# Altium schematic sheet Audio-Interface.SchDoc
size 420 x 297 mm; SheetNumber: 4; SheetTotal: 4
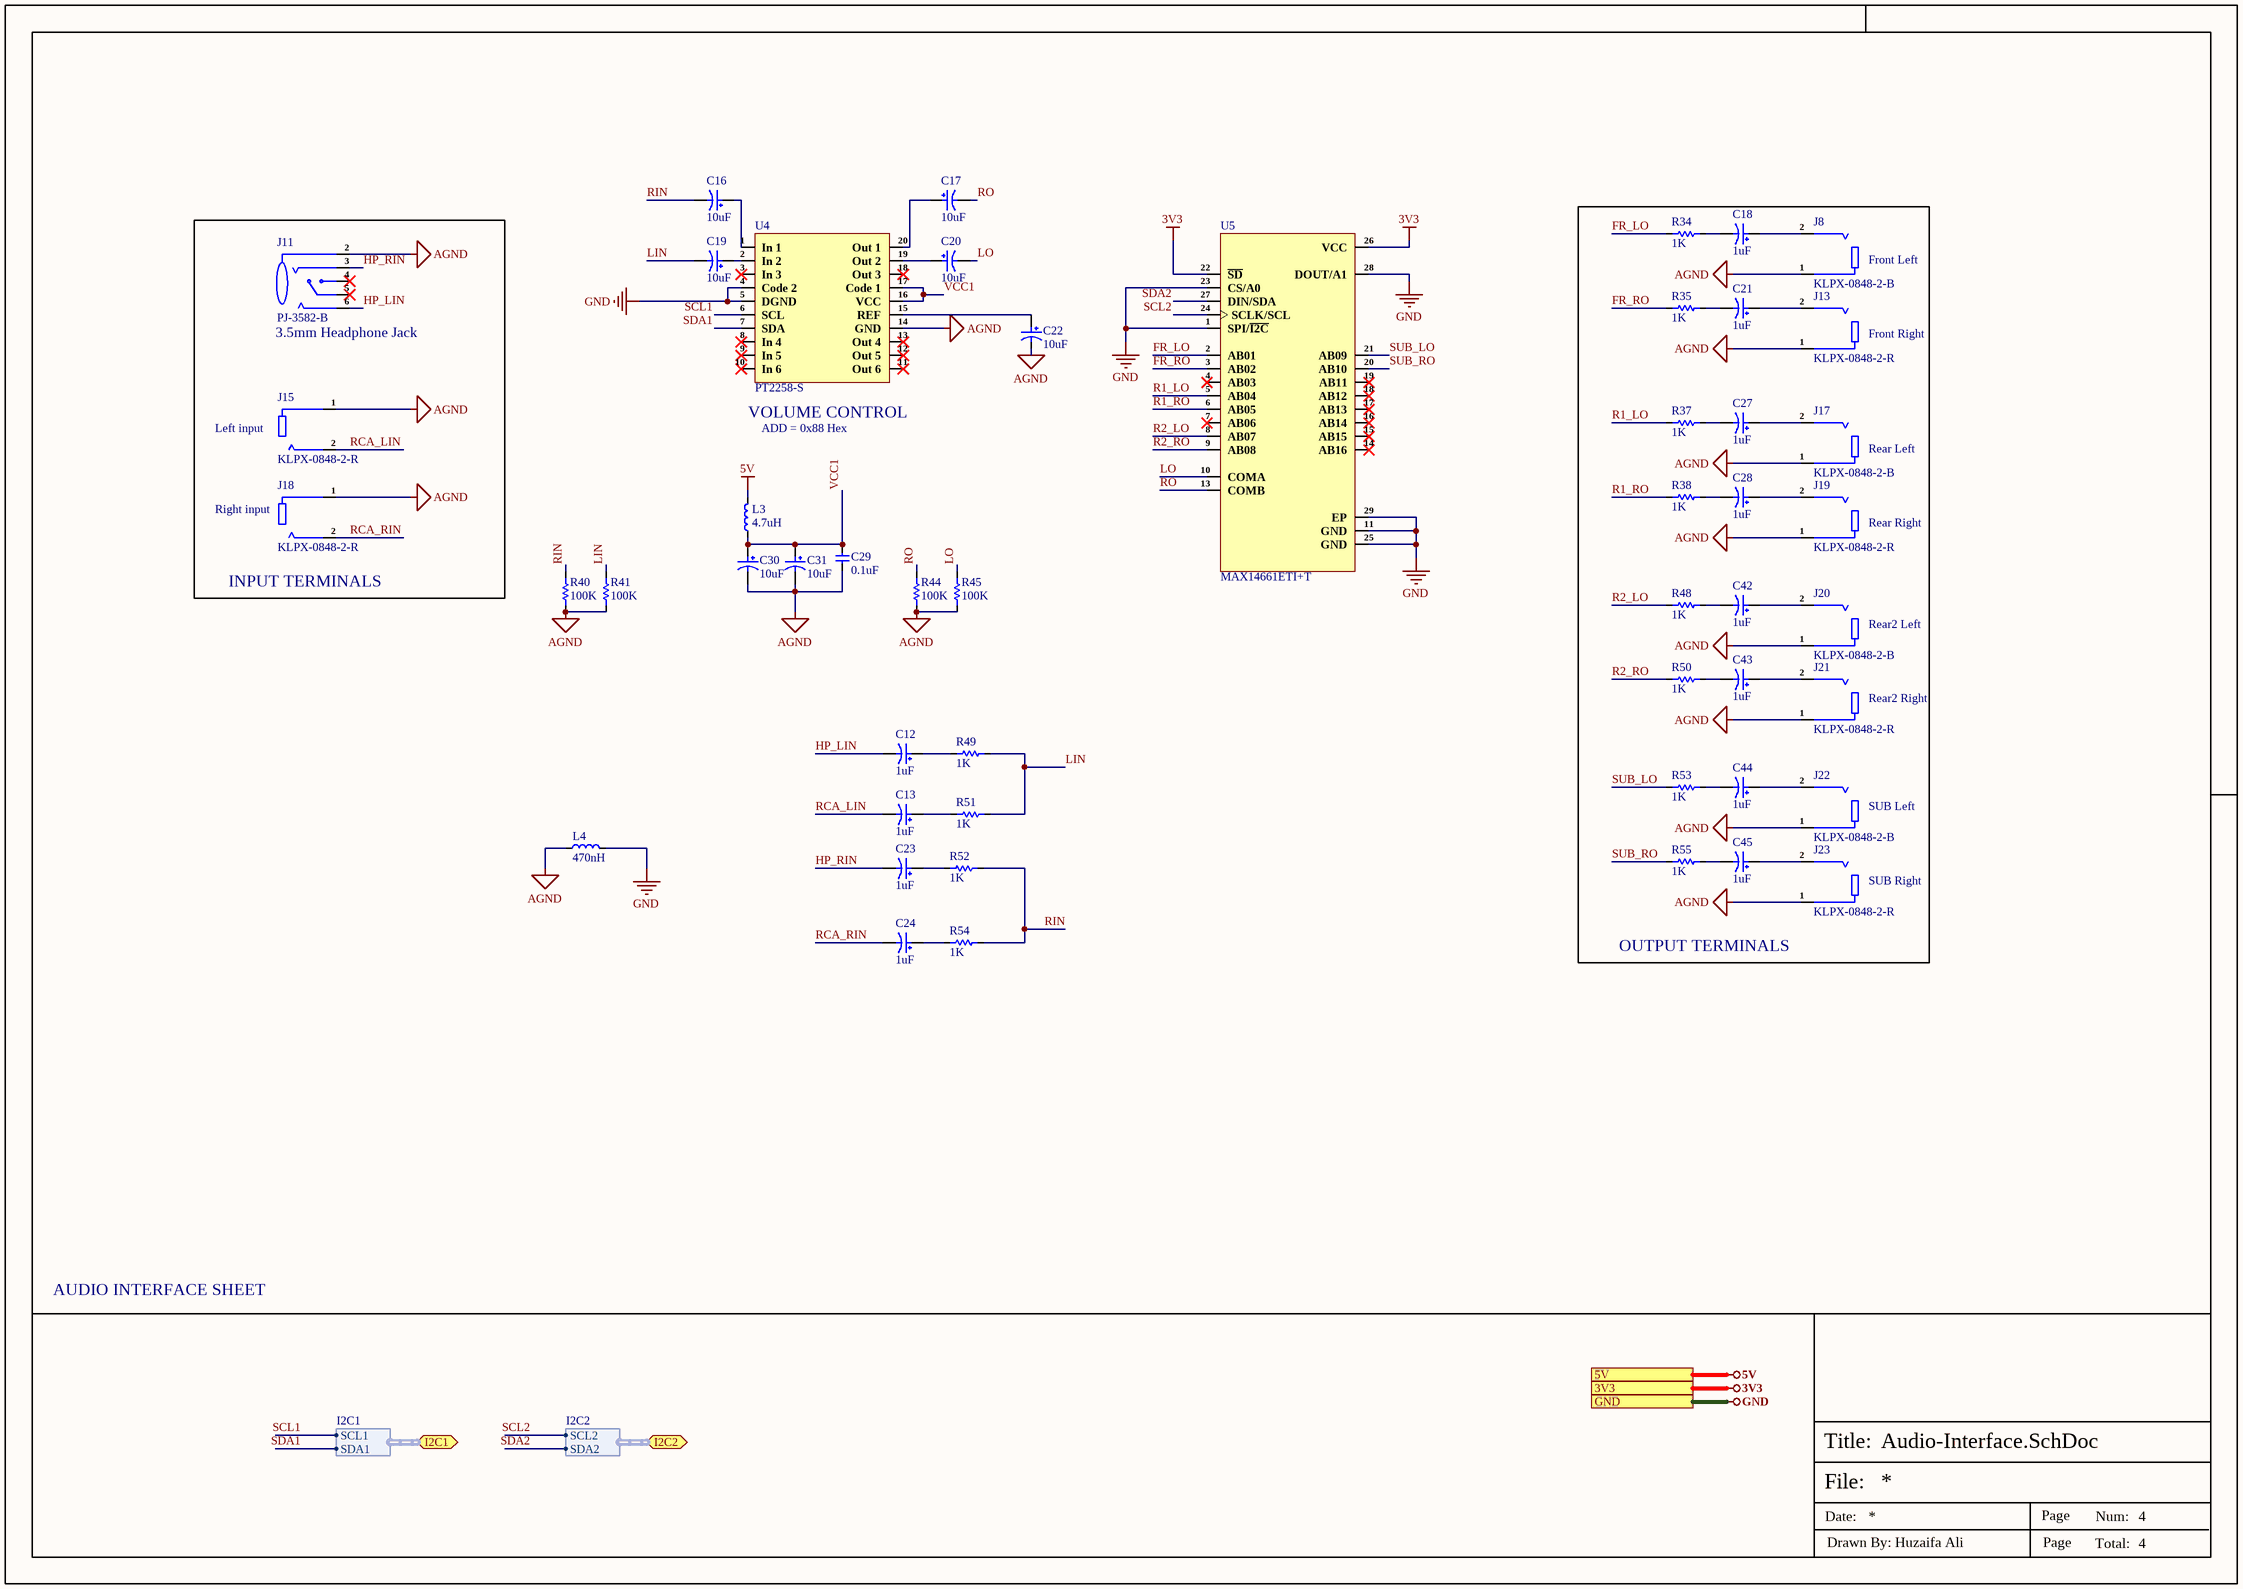
[diagram p0: Audio-Interface.SchDoc]

## Parts
C12  1uF  [865060640001]
C13  1uF  [865060640001]
C16  10uF  [EEEFK1E100R_]
C17  10uF  [EEEFK1E100R_]
C18  1uF  [865060640001]
C19  10uF  [EEEFK1E100R_]
C20  10uF  [EEEFK1E100R_]
C21  1uF  [865060640001]
C22  10uF  [EEEFK1E100R_]
C23  1uF  [865060640001]
C24  1uF  [865060640001]
C27  1uF  [865060640001]
C28  1uF  [865060640001]
C29  0.1uF  [Cap-0402]
C30  10uF  [EEEFK1E100R_]
C31  10uF  [EEEFK1E100R_]
C42  1uF  [865060640001]
C43  1uF  [865060640001]
C44  1uF  [865060640001]
C45  1uF  [865060640001]
J8  KLPX-0848-2-B  [KLPX-0848-2-B]
J11  PJ-3582-B  [PJ-3582-B]
J13  KLPX-0848-2-R  [KLPX-0848-2-R]
J15  KLPX-0848-2-R  [KLPX-0848-2-R]
J17  KLPX-0848-2-B  [KLPX-0848-2-B]
J18  KLPX-0848-2-R  [KLPX-0848-2-R]
J19  KLPX-0848-2-R  [KLPX-0848-2-R]
J20  KLPX-0848-2-B  [KLPX-0848-2-B]
J21  KLPX-0848-2-R  [KLPX-0848-2-R]
J22  KLPX-0848-2-B  [KLPX-0848-2-B]
J23  KLPX-0848-2-R  [KLPX-0848-2-R]
L3  4.7uH  [YPRH0703-4R7M]
L4  470nH  [IND-0806]
R34  1K  [Res-0402]
R35  1K  [Res-0402]
R37  1K  [Res-0402]
R38  1K  [Res-0402]
R40  100K  [Res-0402]
R41  100K  [Res-0402]
R44  100K  [Res-0402]
R45  100K  [Res-0402]
R48  1K  [Res-0402]
R49  1K  [Res-0402]
R50  1K  [Res-0402]
R51  1K  [Res-0402]
R52  1K  [Res-0402]
R53  1K  [Res-0402]
R54  1K  [Res-0402]
R55  1K  [Res-0402]
U4  PT2258-S  [SOP-20-300mil]
U5  MAX14661ETI+T  [28-TQFN (4x4)]

## Blocks framed on the sheet
OUTPUT TERMINALS: C18 C21 C27 C28 C42-C45 J8 J13 J17 J19-J23 R34 R35 R37 R38 R48 R50 R53 R55
INPUT TERMINALS: J11 J15 J18

## Ports
3V3 (see Top_Sheet[4A], Controller-Sheet[2D], Power-Sheet[4D]), 5V (see Top_Sheet[4A], Power-Sheet[4D]), GND (see Top_Sheet[4B], Controller-Sheet[2D], Power-Sheet[4D]), I2C1 (bidir, harness I2C1, see Top_Sheet[4B], Controller-Sheet[2D]), I2C2 (bidir, harness I2C2, see Top_Sheet[4B], Controller-Sheet[3D])

## Harnesses
I2C1: SCL1, SDA1
I2C2: SCL2, SDA2

## Nets
3V3: U5.22(~{SD}) U5.26(VCC) ; port 3V3
5V: L3.2 ; port 5V
AGND: C22.2 C29.1 C30.2 C31.2 J8.1 J11.2 J13.1 J15.1 J17.1 J18.1 J19.1 J20.1 J21.1 J22.1 J23.1 L4.1 R40.1 R41.1 R44.1 R45.1 U4.14(GND)
GND: L4.2 U4.4(Code_2) U4.5(DGND) U5.1(SPI/~{I2C}) U5.11(GND) U5.23(CS/A0) U5.25(GND) U5.28(DOUT/A1) U5.29(EP) ; port GND
FR_LO: R34.1 U5.2(AB01)
FR_RO: R35.1 U5.3(AB02)
HP_LIN: C12.2 J11.6
HP_RIN: C23.2 J11.3
LIN: C19.2 R41.2 R49.2 R51.2
LO: C20.2 R45.2 U5.10(COMA)
R1_LO: R37.1 U5.5(AB04)
R1_RO: R38.1 U5.6(AB05)
R2_LO: R48.1 U5.8(AB07)
R2_RO: R50.1 U5.9(AB08)
RCA_LIN: C13.2 J15.2
RCA_RIN: C24.2 J18.2
RIN: C16.2 R40.2 R52.2 R54.2
RO: C17.2 R44.2 U5.13(COMB)
SCL1: U4.6(SCL) ; port I2C1.SCL1
SCL2: U5.24(SCLK/SCL) ; port I2C2.SCL2
SDA1: U4.7(SDA) ; port I2C1.SDA1
SDA2: U5.27(DIN/SDA) ; port I2C2.SDA2
SUB_LO: R53.1 U5.21(AB09)
SUB_RO: R55.1 U5.20(AB10)
VCC1: C29.2 C30.1 C31.1 L3.1 U4.16(VCC) U4.17(Code_1)
NetC12_1: C12.1 R49.1
NetC13_1: C13.1 R51.1
NetC16_1: C16.1 U4.1(In_1)
NetC17_1: C17.1 U4.20(Out_1)
NetC18_1: C18.1 J8.2
NetC18_2: C18.2 R34.2
NetC19_1: C19.1 U4.2(In_2)
NetC20_1: C20.1 U4.19(Out_2)
NetC21_1: C21.1 J13.2
NetC21_2: C21.2 R35.2
NetC22_1: C22.1 U4.15(REF)
NetC23_1: C23.1 R52.1
NetC24_1: C24.1 R54.1
NetC27_1: C27.1 J17.2
NetC27_2: C27.2 R37.2
NetC28_1: C28.1 J19.2
NetC28_2: C28.2 R38.2
NetC42_1: C42.1 J20.2
NetC42_2: C42.2 R48.2
NetC43_1: C43.1 J21.2
NetC43_2: C43.2 R50.2
NetC44_1: C44.1 J22.2
NetC44_2: C44.2 R53.2
NetC45_1: C45.1 J23.2
NetC45_2: C45.2 R55.2

Not connected (* = marked no-connect by the designer): J11 4* 5*; U4 3(In_3)* 8(In_4)* 9(In_5)* 10(In_6)* 11(Out_6)* 12(Out_5)* 13(Out_4)* 18(Out_3)*; U5 4(AB03)* 7(AB06)* 14(AB16)* 15(AB15)* 16(AB14)* 17(AB13)* 18(AB12)* 19(AB11)*

## Notes on the sheet
- Front Left
- (near J11) 3.5mm Headphone Jack
- Front Right
- (near J15) Left input
- (near U4) VOLUME CONTROL
- ADD = 0x88 Hex
- Rear Left
- (near J18) Right input
- Rear Right
- Rear2 Left
- Rear2 Right
- SUB Left
- SUB Right
- AUDIO INTERFACE SHEET
- File:
- Title:
- Date:
- Page
- Num:
- Total:
- Drawn By: Huzaifa Ali

## Library data of the parts
C12 C13 C18 C21 C23 C24 C27 C28 C42-C45 = 865060640001: CAP ALUM 1UF 20% 50V SMD; Manufacturer: Wurth Electronics; Item Type: Capacitor; Leakage Current: 3uA; Insulation Resistance: 16.6667MR; Supplier: Digikey; Supplier Part Number: 732-8541-1-ND; Manufacturer Part Number: 865060640001; RoHS: Yes; Stock: 18299; Pricing: 1=0.17, 50=0.141, 100=0.123, 250=0.109, 500=0.095, 1000=0.091 (USD); Length: 5.5mm; ComponentLink1URL: http://www.farnell.com/datasheets/1880069.pdf?src-supplier=Farnell; ComponentLink1Description: http://www.farnell.com/datasheets/1880069.pdf?src-supplier=Farnell; ComponentLink2URL: http://www.farnell.com/datasheets/1880069.pdf?src-supplier=Newark; ComponentLink2Description: http://www.farnell.com/datasheets/1880069.pdf?src-supplier=Newark; ComponentLink3URL: https://katalog.we-online.de/pbs/datasheet/865060640001.pdf?src-supplier=Digikey; ComponentLink3Description: https://katalog.we-online.de/pbs/datasheet/865060640001.pdf?src-supplier=Digikey; ComponentLink4URL: http://katalog.we-online.de/pbs/datasheet/865060640001.pdf?src-supplier=Digikey; ComponentLink4Description: http://katalog.we-online.de/pbs/datasheet/865060640001.pdf?src-supplier=Digikey; ComponentLink5URL: http://www.farnell.com/datasheets/1880069.pdf?src-supplier=Element14; ComponentLink5Description: http://www.farnell.com/datasheets/1880069.pdf?src-supplier=Element14
C16 C17 C19 C20 C22 C30 C31 = EEEFK1E100R: CAP ALUM 10UF 20% 25V SMD; Manufacturer: Panasonic; Manufacturer Part Number: EEE-FK1E100R; Dielectric Material: Aluminium; Ripple Current: 90mA; ESR (Equivalent Series Resistance): 1.35R; Polarity: Polar; Life (Hours): 2000Hour; Leakage Current: 3uA; Item Type: Capacitor; Supplier 1: Digi-Key; Stock 1: 332; Pricing 1: 1=0.38, 10=0.264, 50=0.1852, 100=0.1587, 500=0.11902, 1000=0.10051 (USD); Mount: Surface Mount,PCB; Case/Package: Radial; Number of Pins: 2; Contact Plating: Tin; Min Operating Temperature: -55°C; Max Operating Temperature: 105°C; Capacitance: 10uF; Tolerance: 20%; Voltage Rating (DC): 25V; Packaging: Tape and Reel; Voltage Rating: 25V; Ripple Current (AC): 90mA; Impedance: 1.35R; Package Quantity: 1; Termination: SMD/SMT; Voltage: 25V; Series: FK; Construction: Cylindrical; Diameter: 4mm; Length: 5.8mm; Width: 5.5mm; Height: 5.8mm; Height - Seated (Max): 0.24inch; Radiation Hardening: No; REACH SVHC: No SVHC; Lead Free: Lead Free; RoHS Compliant: Yes; ComponentLink1URL: http://www.jameco.com/Jameco/Products/ProdDS/1357642.pdf?src-supplier=Jameco; ComponentLink1Description: http://www.jameco.com/Jameco/Products/ProdDS/1357642.pdf?src-supplier=Jameco; ComponentLink2URL: http://www.farnell.com/datasheets/2002520.pdf?src-supplier=Farnell; ComponentLink2Description: http://www.farnell.com/datasheets/2002520.pdf?src-supplier=Farnell; ComponentLink3URL: http://www.farnell.com/datasheets/58258.pdf?src-supplier=Element14; ComponentLink3Description: http://www.farnell.com/datasheets/58258.pdf?src-supplier=Element14; ComponentLink4URL: http://www.mouser.com/ds/2/315/ABA0000CE120-68386.pdf?src-supplier=Mouser; ComponentLink4Description: http://www.mouser.com/ds/2/315/ABA0000CE120-68386.pdf?src-supplier=Mouser; ComponentLink5URL: http://uk.rs-online.com/webdocs/139e/0900766b8139e400.pdf?src-supplier=RSComponents; ComponentLink5Description: http://uk.rs-online.com/webdocs/139e/0900766b8139e400.pdf?src-supplier=RSComponents; ComponentLink6URL: http://www.farnell.com/datasheets/2813657.pdf?src-supplier=Farnell; ComponentLink6Description: http://www.farnell.com/datasheets/2813657.pdf?src-supplier=Farnell; ComponentLink7URL: http://www.farnell.com/datasheets/2002520.pdf?src-supplier=Element14; ComponentLink7Description: http://www.farnell.com/datasheets/2002520.pdf?src-supplier=Element14; ComponentLink8URL: http://www.farnell.com/datasheets/1676921.pdf?src-supplier=Element14; ComponentLink8Description: http://www.farnell.com/datasheets/1676921.pdf?src-supplier=Element14; ComponentLink9URL: http://industrial.panasonic.com/www-data/pdf/ABA0000/ABA0000CE120.pdf?src-supplier=Avnet; ComponentLink9Description: http://industrial.panasonic.com/www-data/pdf/ABA0000/ABA0000CE120.pdf?src-supplier=Avnet; ComponentLink10URL: http://industrial.panasonic.com/www-data/pdf/ABA0000/ABA0000CE120.pdf?src-supplier=Future+Electronics; ComponentLink10Description: http://industrial.panasonic.com/www-data/pdf/ABA0000/ABA0000CE120.pdf?src-supplier=Future+Electronics; ComponentLink11URL: https://www.verical.com/server-webapp/html/getDatasheet?partID=134702&src-supplier=Verical; ComponentLink11Description: https://www.verical.com/server-webapp/html/getDatasheet?partID=134702&src-supplier=Verical; ComponentLink12URL: http://industrial.panasonic.com/www-data/pdf/ABA0000/ABA0000CE120.pdf?src-supplier=Avnet+Europe; ComponentLink12Description: http://industrial.panasonic.com/www-data/pdf/ABA0000/ABA0000CE120.pdf?src-supplier=Avnet+Europe; Supplier Part Number 1: PCE3795CT-ND; LCSC Part Number: C178538
C29 = CC0402KRX7R8BB104: CAP CER 0.1UF 25V X7R 0402; Manufacturer: Yageo; Tolerance: 10%; Capacitance: 100nF; Dissipation Factor: 3.5%; Supplier 1: Digi-Key; Manufacturer Part Number: CC0402KRX7R8BB104; RoHS: Yes; Category: Ceramic Capacitors; Stock 1: 1841009; Pricing 1: 1=0.10000, 10=0.03100, 50=0.01700, 100=0.01390, 500=0.00990, 1000=0.00777, 2500=0.00707, 5000=0.00650 (USD); Mount: Surface Mount; Case/Package: 0402; Case Code (Imperial): 0402; Case Code (Metric): 1005; Min Operating Temperature: -55°C; Max Operating Temperature: 125°C; Dielectric: X7R; Voltage Rating: 25V; Voltage Rating (DC): 25V; Packaging: Tape and Reel; Termination: SMD/SMT; Resistor Type: Ceramic; Length: 1mm; Width: 0.02inch; Height: 0.5mm; Thickness: 0.022inch; Depth: 0.5mm; Radiation Hardening: No; Lead Free: Lead Free; Halogen Free: Halogen Free; ComponentLink1URL: https://datasheet.ciiva.com/11464/upy-gphc-x7r-6-3v-to-50v-8-11464889.pdf?src-supplier=Avnet; ComponentLink1Description: https://datasheet.ciiva.com/11464/upy-gphc-x7r-6-3v-to-50v-8-11464889.pdf?src-supplier=Avnet; ComponentLink2URL: https://datasheet.ciiva.com/13210/upy-gphc-x7r-6-3v-to-50v-8-12304-13210908.pdf?src-supplier=Mouser; ComponentLink2Description: https://datasheet.ciiva.com/13210/upy-gphc-x7r-6-3v-to-50v-8-12304-13210908.pdf?src-supplier=Mouser; ComponentLink3URL: https://datasheet.ciiva.com/17437/upy-gphc-x7r-6-3v-to-50v-8-17437357.pdf?src-supplier=Avnet+Europe; ComponentLink3Description: https://datasheet.ciiva.com/17437/upy-gphc-x7r-6-3v-to-50v-8-17437357.pdf?src-supplier=Avnet+Europe; Supplier Part Number 1: 311-2077-1-ND; LCSC Part Number: C105883
J8 J17 J20 J22 = KLPX-0848-2-B: RCA PHONO JACK, VERTICAL, BLK RO; Manufacturer: Kycon; Item Type: Connectors; Supplier: Digikey; Supplier Part Number: 2092-KLPX-0848-2-B-ND; Manufacturer Part Number: KLPX-0848-2-B; RoHS: Yes; Stock: 3463; Pricing: 1=0.98, 10=0.826, 25=0.7928, 50=0.7758, 100=0.7421, 250=0.67468, 500=0.60722, 1000=0.53974, 2500=0.48914 (USD); ComponentLink1URL: http://www.mouser.com/ds/2/222/KLPX-334830.pdf?src-supplier=Mouser; ComponentLink1Description: http://www.mouser.com/ds/2/222/KLPX-334830.pdf?src-supplier=Mouser; ComponentLink2URL: http://domino2.kycon.com/catalog_PDF/Standard%20Catalog%20page/RCA%20Phono%20Jacks/SKLPX.pdf?src-supplier=Avnet; ComponentLink2Description: http://domino2.kycon.com/catalog_PDF/Standard%20Catalog%20page/RCA%20Phono%20Jacks/SKLPX.pdf?src-supplier=Avnet; ComponentLink3URL: http://www.kycon.com/2013Catalogpage/RCA/KLPX.pdf?src-supplier=Digikey; ComponentLink3Description: http://www.kycon.com/2013Catalogpage/RCA/KLPX.pdf?src-supplier=Digikey; ComponentLink4URL: https://datasheet.octopart.com/KLPX-0848-2-B-Kycon-datasheet-116534117.pdf?src-supplier=Toby+Electronics; ComponentLink4Description: https://datasheet.octopart.com/KLPX-0848-2-B-Kycon-datasheet-116534117.pdf?src-supplier=Toby+Electronics
J11 = PJ-3582-B: 20℃~+70℃ 3.5mm Headphone Jack 235℃ 30V 500mA Plugin Audio Connectors (Headphones) ROHS; Manufacturer: XKB Connection; Manufacturer Part Number: PJ-3582-B; Package: Plugin; LCSC Part Number: C500090; Item Type: Audio Connectors; ComponentLink1Description: LCSC; ComponentLink1URL: https://www.lcsc.com/product-detail/Audio-Connectors-Headphones_XKB-Connection-PJ-3582-B_C500090.html
J13 J15 J18 J19 J21 J23 = KLPX-0848-2-R: RCA PHONO JACK, VERTICAL, RED RO; Manufacturer: Kycon; Item Type: Connectors; Supplier: Digikey; Supplier Part Number: 2092-KLPX-0848-2-R-ND; Manufacturer Part Number: KLPX-0848-2-R; RoHS: Yes; Stock: 613; Pricing: 1=1.16, 10=0.885, 25=0.7956, 50=0.7348, 100=0.6795, 250=0.61388, 500=0.5695, 1000=0.52924, 2500=0.48174 (USD); ComponentLink1URL: http://www.mouser.com/ds/2/222/KLPX-334830.pdf?src-supplier=Mouser; ComponentLink1Description: http://www.mouser.com/ds/2/222/KLPX-334830.pdf?src-supplier=Mouser; ComponentLink2URL: http://domino2.kycon.com/catalog_PDF/Standard%20Catalog%20page/RCA%20Phono%20Jacks/SKLPX.pdf?src-supplier=Avnet; ComponentLink2Description: http://domino2.kycon.com/catalog_PDF/Standard%20Catalog%20page/RCA%20Phono%20Jacks/SKLPX.pdf?src-supplier=Avnet; ComponentLink3URL: http://www.kycon.com/2013Catalogpage/RCA/KLPX.pdf?src-supplier=Digikey; ComponentLink3Description: http://www.kycon.com/2013Catalogpage/RCA/KLPX.pdf?src-supplier=Digikey; ComponentLink4URL: https://datasheet.octopart.com/KLPX-0848-2-R-Kycon-datasheet-116534117.pdf?src-supplier=Toby+Electronics; ComponentLink4Description: https://datasheet.octopart.com/KLPX-0848-2-R-Kycon-datasheet-116534117.pdf?src-supplier=Toby+Electronics
L3 = YPRH0703-4R7M: 2.26A 4.7uH ±20% SMD,7.3x7.3mm Power Inductors ROHS; Manufacturer: YJYCOIN; Manufacturer Part Number: YPRH0703-4R7M; Package: SMD,7.3x7.3mm; LCSC Part Number: C338836; Item type: Inductor; ComponentLink1Description: LCSC; ComponentLink1URL: https://www.lcsc.com/product-detail/Power-Inductors_YJYCOIN-YPRH0703-4R7M_C338836.html
L4 = 1286AS-H-R47M=P2: FIXED IND 470NH 3.4A 52 MOHM SMD; Manufacturer: Murata; Core Material: Ferrite; Shielding: Shielded; DC Resistance (DCR): 52mR; Test Frequency: 1MHz; Max DC Current: 3.8A; Tolerance: 20%; Item Type: Inductor; Supplier: Digi-Key; Supplier Part Number: 490-10606-1-ND; Manufacturer Part Number: 1286AS-H-R47M=P2; RoHS: Yes; Category: Fixed Inductors; Stock: 12493; Pricing: 1=0.39, 10=0.348, 25=0.3048, 50=0.2612, 100=0.2394, 250=0.21764, 500=0.2046, 1000=0.15671 (USD); Mounting Technology: Surface Mount; Case/Package: 0806; Case Code (Metric): 2016; Case Code (Imperial): 0806; Min Operating Temperature: -40°C; Max Operating Temperature: 85°C; Value: 470nH; Packaging: Cut Tape; Current Rating: 3.4A; Series: DFE201612C; Length: 0.079inch; Width: 0.063inch; Height - Seated (Max): 0.047inch; Depth: 1.6mm; RoHS Compliant: Yes; ComponentLink1URL: http://www.farnell.com/datasheets/2021974.pdf?src-supplier=Farnell; ComponentLink1Description: http://www.farnell.com/datasheets/2021974.pdf?src-supplier=Farnell; ComponentLink2URL: http://www.toko.co.jp/products/pdf/inductors/dfe201612c.pdf?src-supplier=Avnet; ComponentLink2Description: http://www.toko.co.jp/products/pdf/inductors/dfe201612c.pdf?src-supplier=Avnet; ComponentLink3URL: http://search.murata.co.jp/Ceramy/image/img/P02/J(E)TE243A-0010_DFE201612C_reference.pdf?src-supplier=Digi-Key; ComponentLink3Description: http://search.murata.co.jp/Ceramy/image/img/P02/J(E)TE243A-0010_DFE201612C_reference.pdf?src-supplier=Digi-Key; ComponentLink4URL: http://www.toko.co.jp/products/pdf/inductors/dfe201612c.pdf?src-supplier=Digi-Key; ComponentLink4Description: http://www.toko.co.jp/products/pdf/inductors/dfe201612c.pdf?src-supplier=Digi-Key; LCSC Part Number: C160957
R34 R35 R37 R38 R48-R55 = RC0402FR-071KL: RES 1K OHM 1% 1/16W 0402; Manufacturer: Yageo; Resistance: 1kR; Temperature Coefficient: 100ppm/°C; Voltage Rating (DC): 50V; Power Rating: 62.5mW; Max Power Dissipation: 63mW; Item Type: Resistor; Supplier 1: Avnet; Manufacturer Part Number: RC0402FR-071KL; RoHS: Yes; Category: Chip SMD Resistors; Stock 1: 13030000; Pricing 1: 10000=0.00085, 20000=0.00087, 40000=0.00084, 60000=0.00083, 80000=0.00079, 100000=0.00078, 1000000=0.00076 (USD); Case/Package: 0402; Number of Pins: 2; Case Code (Imperial): 0402; Case Code (Metric): 1005; Size Code: 0402; Min Operating Temperature: -55°C; Max Operating Temperature: 155°C; Resistor Type: Thick Film; Tolerance: 1%; Packaging: Tape and Reel; Voltage Rating: 50V; Termination: SMD/SMT; Features: Moisture Resistant; Series: RC; Number of Terminations: 2; Resistance Tolerance: 1%; Construction: Rectangular; Technology: THICK FILM; Length: 1mm; Width: 0.5mm; Height: 0.32mm; Depth: 0.5mm; Reach SVHC Compliant: Yes; Lead Free: Lead Free; RoHS Compliant: Yes; Military Standard: Not; ComponentLink1URL: https://datasheet.ciiva.com/11819/0900766b80c66297-11819477.pdf?src-supplier=RSComponents; ComponentLink1Description: https://datasheet.ciiva.com/11819/0900766b80c66297-11819477.pdf?src-supplier=RSComponents; ComponentLink2URL: https://datasheet.ciiva.com/7983/1018594-7983502.pdf?src-supplier=Element14; ComponentLink2Description: https://datasheet.ciiva.com/7983/1018594-7983502.pdf?src-supplier=Element14; ComponentLink3URL: https://datasheet.ciiva.com/22747/1018594-22747513.pdf?src-supplier=Element14; ComponentLink3Description: https://datasheet.ciiva.com/22747/1018594-22747513.pdf?src-supplier=Element14; ComponentLink4URL: https://datasheet.ciiva.com/12666/pyu-rc0402-51-rohs-l-6-r-12666741.pdf?src-supplier=Mouser; ComponentLink4Description: https://datasheet.ciiva.com/12666/pyu-rc0402-51-rohs-l-6-r-12666741.pdf?src-supplier=Mouser; ComponentLink5URL: https://datasheet.ciiva.com/7849/1018594-7849869.pdf?src-supplier=Element14; ComponentLink5Description: https://datasheet.ciiva.com/7849/1018594-7849869.pdf?src-supplier=Element14; ComponentLink6URL: https://datasheet.ciiva.com/7849/1018594-7849871.pdf?src-supplier=Element14; ComponentLink6Description: https://datasheet.ciiva.com/7849/1018594-7849871.pdf?src-supplier=Element14; ComponentLink7URL: https://datasheet.ciiva.com/17063/pyu-rc0402-51-rohs-l-6-r-17063193.pdf?src-supplier=Future+Electronics; ComponentLink7Description: https://datasheet.ciiva.com/17063/pyu-rc0402-51-rohs-l-6-r-17063193.pdf?src-supplier=Future+Electronics; Supplier Part Number 1: RC0402FR-071KL; LCSC Part Number: C106235
R40 R41 R44 R45 = RC0402FR-07100KL: RES 100K OHM 1% 1/16W 0402; Manufacturer: Yageo; Resistance: 100kR; Temperature Coefficient: 100ppm/°C; Power Rating: 63mW; Voltage Rating: 50V; Item Type: Resistor; Supplier 1: Mouser; Manufacturer Part Number: RC0402FR-07100KL; RoHS: Yes; Category: Chip SMD Resistors; Stock 1: 7759549; Pricing 1: 1=0.10000, 10=0.01200, 50=0.01200, 100=0.00500, 1000=0.00300, 2500=0.00200, 10000=0.00100 (USD); Case/Package: 0402; Case Code (Metric): 1005; Case Code (Imperial): 0402; Min Operating Temperature: -55°C; Max Operating Temperature: 155°C; Resistor Type: Thick Film; Tolerance: 1%; Packaging: Tape and Reel; Package Quantity: 1; Number of Terminations: 2; Termination: SMD/SMT; Max Power Dissipation: 63mW; Working Voltage: 50V; Features: Moisture Resistant; Series: RC; Resistance Tolerance: 1%; Construction: Rectangular; Technology: THICK FILM; Length: 0.039inch; Width: 0.02inch; Height: 0.016inch; Depth: 0.5mm; REACH SVHC: No SVHC; Lead Free: Lead Free; RoHS Compliant: Yes; Military Standard: Not; ComponentLink1URL: https://datasheet.ciiva.com/11819/0900766b80c66297-11819452.pdf?src-supplier=RSComponents; ComponentLink1Description: https://datasheet.ciiva.com/11819/0900766b80c66297-11819452.pdf?src-supplier=RSComponents; ComponentLink2URL: https://datasheet.ciiva.com/22747/1018594-22747509.pdf?src-supplier=Element14; ComponentLink2Description: https://datasheet.ciiva.com/22747/1018594-22747509.pdf?src-supplier=Element14; ComponentLink3URL: https://datasheet.ciiva.com/2453/pyu-r-int-thick-7-2453362.pdf?src-supplier=Digi-Key; ComponentLink3Description: https://datasheet.ciiva.com/2453/pyu-r-int-thick-7-2453362.pdf?src-supplier=Digi-Key; ComponentLink4URL: https://datasheet.ciiva.com/2453/pyu-r-int-thick-7-2453363.pdf?src-supplier=Digi-Key; ComponentLink4Description: https://datasheet.ciiva.com/2453/pyu-r-int-thick-7-2453363.pdf?src-supplier=Digi-Key; ComponentLink5URL: https://datasheet.ciiva.com/2453/pyu-r-int-thick-7-2453361.pdf?src-supplier=Digi-Key; ComponentLink5Description: https://datasheet.ciiva.com/2453/pyu-r-int-thick-7-2453361.pdf?src-supplier=Digi-Key; ComponentLink6URL: https://datasheet.ciiva.com/12667/pyu-rc0402-51-rohs-l-6-r-12667930.pdf?src-supplier=Mouser; ComponentLink6Description: https://datasheet.ciiva.com/12667/pyu-rc0402-51-rohs-l-6-r-12667930.pdf?src-supplier=Mouser; ComponentLink7URL: https://datasheet.ciiva.com/15189/getdatasheetpartid-323696-15189334.pdf?src-supplier=Verical; ComponentLink7Description: https://datasheet.ciiva.com/15189/getdatasheetpartid-323696-15189334.pdf?src-supplier=Verical; Supplier Part Number 1: 603-RC0402FR-07100KL; LCSC Part Number: C60491
U4 = PT2258-S: SOP-20-300mil Audio Interface ICs ROHS; Manufacturer: PTC; Item Type: IC; Manufacturer Part Number: PT2258-S; Package: SOP-20-300mil; LCSC Part Number: C99213; ComponentLink1Description: LCSC; ComponentLink1URL: https://www.lcsc.com/product-detail/Audio-Interface-ICs_PTC-Princeton-Tech-PT2258-S_C99213.html
U5 = MAX14661ETI+T: IC MUX 16:2 8OHM 28TQFN; Manufacturer: Maxim; Number of Circuits: 1; -3db Bandwidth: 60MHz; Supplier: Mouser; LCSC Part Number: C2673449; Manufacturer Part Number: MAX14661ETI+T; RoHS: Yes; Item Type: IC; Stock: 4736; Pricing: 1=11.47, 10=8.67, 50=7.73, 100=6.68, 1000=5.63, 10000=5.62 (USD); Pins: 28; Min Operating Temperature: -40°C; Max Operating Temperature: 85°C; Packaging: Tape and Reel; Package Quantity: 2500; Series: -; RoHS Compliant: Yes; ComponentLink1URL: http://www.mouser.com/ds/2/256/MAX14661-263830.pdf?src-supplier=Mouser; ComponentLink1Description: http://www.mouser.com/ds/2/256/MAX14661-263830.pdf?src-supplier=Mouser; ComponentLink2URL: https://datasheets.maximintegrated.com/en/ds/MAX14661.pdf?src-supplier=Digikey; ComponentLink2Description: https://datasheets.maximintegrated.com/en/ds/MAX14661.pdf?src-supplier=Digikey; ComponentLink3URL: http://datasheets.maximintegrated.com/en/ds/MAX14661.pdf?src-supplier=Digikey; ComponentLink3Description: http://datasheets.maximintegrated.com/en/ds/MAX14661.pdf?src-supplier=Digikey